# EAGLE design arca-sensor (EAGLE 9.6.2)
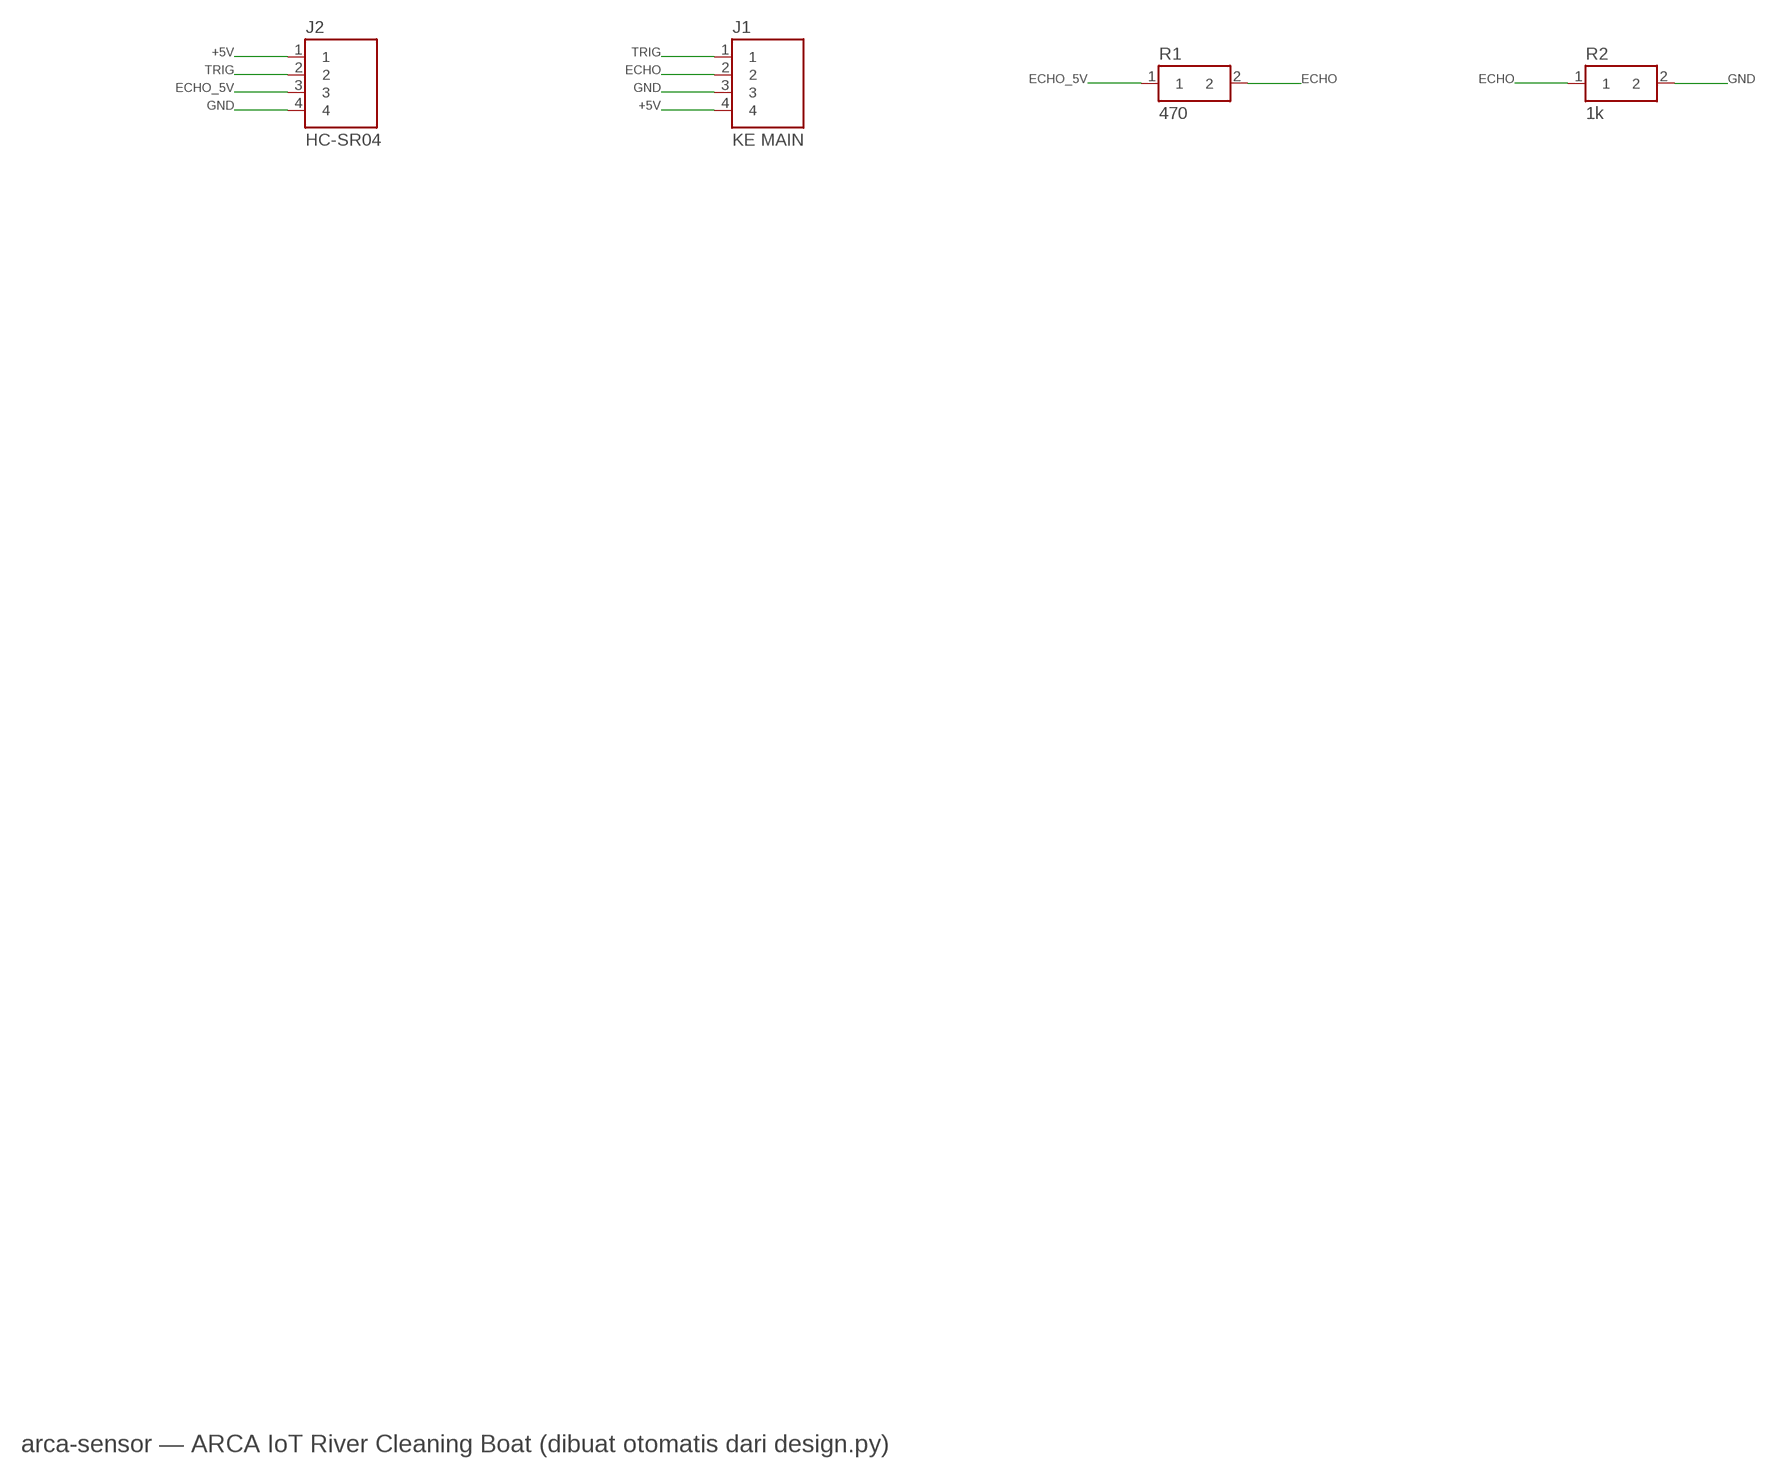
[diagram p0: schematic, sheet 1]

## Parts
J1  KE MAIN  HDR4  [HDR1X4_H]
J2  HC-SR04  HDR4F  [HDR1X4_H]
R1  470  RESV  [RES_V_2.54]
R2  1k  RESV  [RES_V_2.54]

## Nets
+5V [power]: J1.4 J2.1
ECHO: J1.2 R1.2 R2.1
ECHO_5V: J2.3 R1.1
GND [power]: J1.3 J2.4 R2.2
TRIG: J1.1 J2.2

## Notes on the sheet
- arca-sensor — ARCA IoT River Cleaning Boat (dibuat otomatis dari design.py)

## Library data of the parts
J1 = arca:HDR4: Header 1x4 2.54 (male / JST-XH / KF2510)
J2 = arca:HDR4F: Socket 1x4 female untuk HC-SR04
R1 R2 = arca:RESV: Resistor 1/4W berdiri

## Board
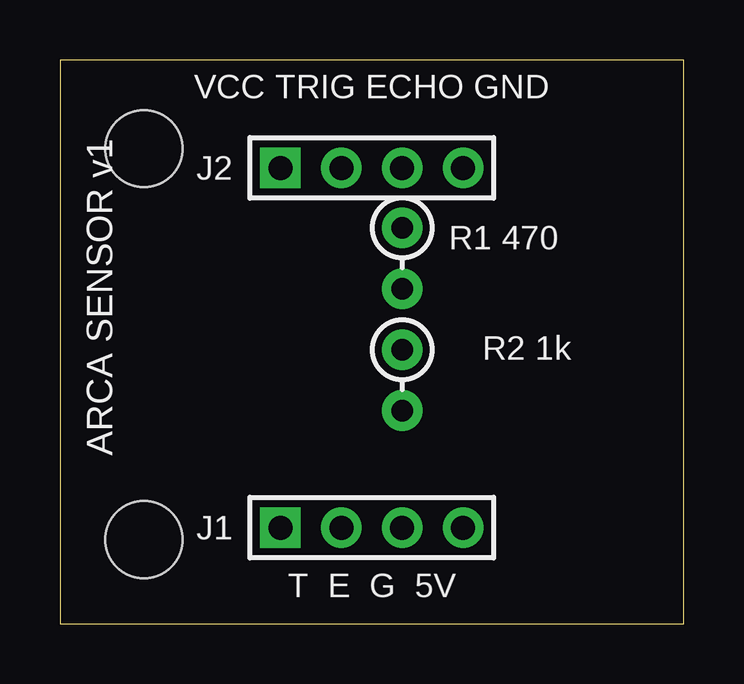
[diagram p1: board, top side]
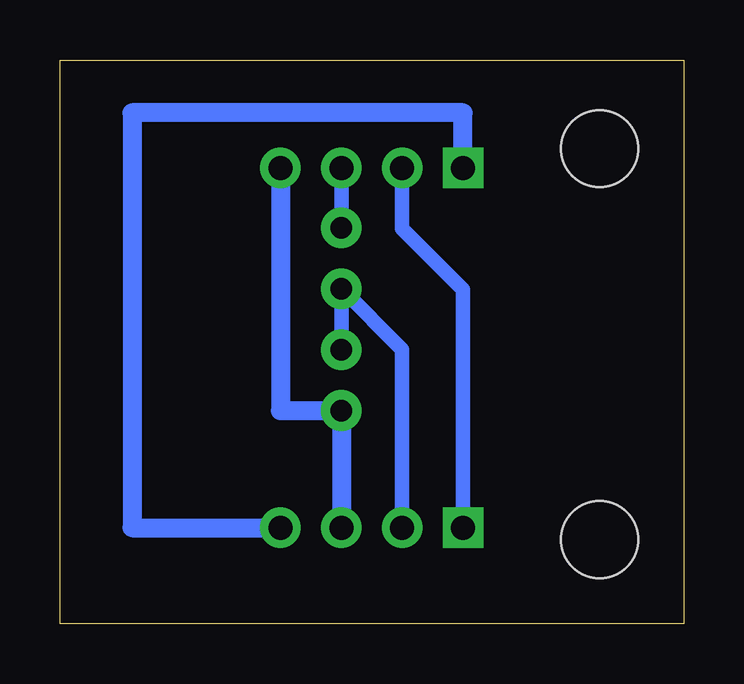
[diagram p2: board, bottom side, seen from below]

Size 26 x 23.5 mm. Coordinates in mm from the lower left corner, seen from the top.
Outline: 0,0 26,0 26,23.5 0,23.5 0,0
Copper layers (16): Bottom
Design rules "arca-1layer": minimum track width 0.4mm, minimum drill 0.8mm, track to track 0.4mm, track to pad 0.4mm, pad to pad 0.4mm, via to via 0.4mm, copper to edge 0.8mm, drill to drill 0.4mm, minimum pad ring 0.3mm, stop-mask expansion 0.1mm
Holes 3.2 mm at 3.5,3.5 3.5,19.8

### Footprints (pad centres in the part's own frame; a part is rotated, then mirrored left to right if it is on the bottom)
HDR1X4_H = drill 1 pad 1.7 square: 1 -3.81,0 | drill 1 pad 1.7 round: 2 -1.27,0; 3 1.27,0; 4 3.81,0
RES_V_2.54 = drill 0.9 pad 1.7 round: 1 0,1.27; 2 0,-1.27

### Placement (x,y rotation side)
J1  13,4 0 top
J2  13,19 0 top
R1  14.27,15.23 0 top
R2  14.27,10.15 0 top

### Tracks (layer width: path | path; a pad name or v marks a point on that pad's centre or on a via)
+5V
  Bottom 0.8: J2.1 9.19,21.3 23,21.3 23,4 J1.4
ECHO
  Bottom 0.6: R2.1 R1.2 11.73,11.42 J1.2
ECHO_5V
  Bottom 0.6: J2.3 R1.1
GND
  Bottom 0.8: J2.4 16.81,8.88 R2.2 J1.3
TRIG
  Bottom 0.6: J2.2 11.73,16.46 9.19,13.92 J1.1

### Text on the board
tPlace: VCC TRIG ECHO GND | R1 470 | R2 1k | ARCA SENSOR v1 | T E G 5V